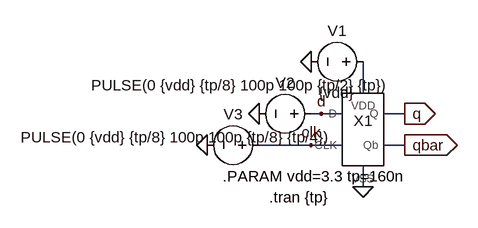
[diagram p0: schematic D_flipflop_tb_tran.asc]
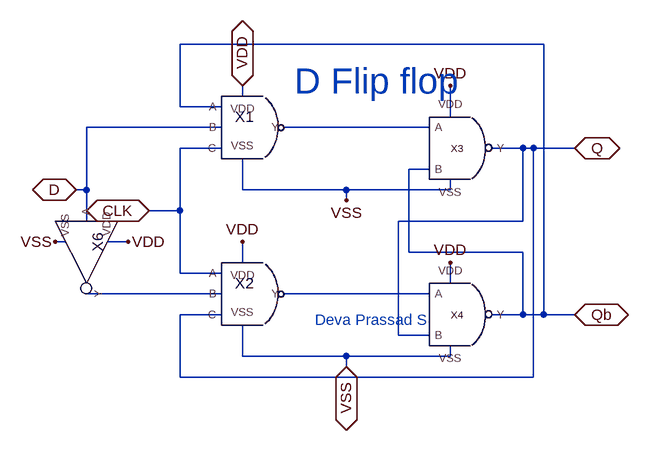
[diagram p1: sub-circuit d_flipflop.asc]
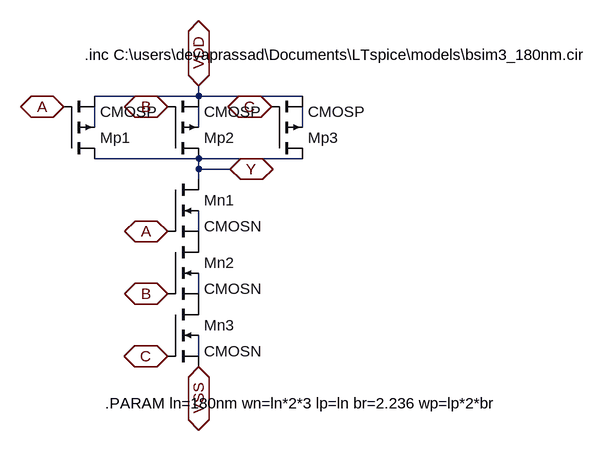
[diagram p2: sub-circuit nand3.asc]
D_flipflop_tb_tran.asc, the LTspice schematic file:
Version 4.1
SHEET 1 880 680
WIRE 192 96 192 48
WIRE 128 128 112 128
WIRE 160 128 128 128
WIRE 256 128 224 128
WIRE 112 176 32 176
WIRE 160 176 112 176
WIRE 256 176 224 176
WIRE 192 240 192 208
FLAG 192 240 0
FLAG 256 176 qbar
IOPIN 256 176 Out
FLAG 256 128 q
IOPIN 256 128 Out
FLAG 112 48 0
FLAG 32 128 0
FLAG -48 176 0
FLAG 112 176 clk
FLAG 128 128 d
SYMBOL voltage 208 48 R90
WINDOW 0 -32 56 VBottom 2
WINDOW 3 32 56 VTop 2
WINDOW 123 0 0 Left 0
WINDOW 39 0 0 Left 0
SYMATTR InstName V1
SYMATTR Value {vdd}
SYMBOL voltage 128 128 R90
WINDOW 0 -32 56 VBottom 2
WINDOW 3 -60 123 VTop 2
WINDOW 123 0 0 Left 0
WINDOW 39 0 0 Left 0
SYMATTR InstName V2
SYMATTR Value PULSE(0 {vdd} {tp/8} 100p 100p {tp/2} {tp})
SYMBOL voltage 48 176 R90
WINDOW 0 -32 56 VBottom 2
WINDOW 3 -28 141 VTop 2
WINDOW 123 0 0 Left 0
WINDOW 39 0 0 Left 0
SYMATTR InstName V3
SYMATTR Value PULSE(0 {vdd} {tp/8} 100p 100p {tp/8} {tp/4})
SYMBOL diglib\\flipflop1x\\D_flipflop 192 192 R0
SYMATTR InstName X1
TEXT 48 256 Left 2 !.tran {tp}
TEXT -24 224 Left 2 !.PARAM vdd=3.3 tp=160n

d_flipflop.asc, the sub-circuit schematic file:
Version 4.1
SHEET 1 1448 680
WIRE 640 -208 80 -208
WIRE 176 -128 176 -144
WIRE 80 -112 80 -208
WIRE 144 -112 80 -112
WIRE 496 -96 496 -144
WIRE 144 -80 -64 -80
WIRE 464 -80 240 -80
WIRE 144 -48 80 -48
WIRE 608 -48 560 -48
WIRE 624 -48 608 -48
WIRE 688 -48 624 -48
WIRE 464 -16 432 -16
WIRE -64 16 -64 -80
WIRE -64 16 -80 16
WIRE 176 16 176 -32
WIRE 336 16 176 16
WIRE 496 16 496 0
WIRE 496 16 336 16
WIRE 336 32 336 16
WIRE 80 48 80 -48
WIRE 80 48 32 48
WIRE -64 64 -64 16
WIRE 608 64 608 -48
WIRE 608 64 416 64
WIRE -96 96 -112 96
WIRE 0 96 -32 96
WIRE 432 112 432 -16
WIRE 608 112 432 112
WIRE 176 128 176 96
WIRE 80 144 80 48
WIRE 144 144 80 144
WIRE 496 160 496 128
WIRE 144 176 -64 176
WIRE 464 176 240 176
WIRE 144 208 80 208
WIRE 608 208 608 112
WIRE 608 208 560 208
WIRE 640 208 640 -208
WIRE 640 208 608 208
WIRE 688 208 640 208
WIRE 416 240 416 64
WIRE 464 240 416 240
WIRE 176 272 176 224
WIRE 336 272 176 272
WIRE 496 272 496 256
WIRE 496 272 336 272
WIRE 336 288 336 272
WIRE 80 304 80 208
WIRE 624 304 624 -48
WIRE 624 304 80 304
FLAG 32 48 CLK
IOPIN 32 48 BiDir
FLAG 688 208 Qb
IOPIN 688 208 BiDir
FLAG 688 -48 Q
IOPIN 688 -48 BiDir
FLAG 176 -144 VDD
IOPIN 176 -144 BiDir
FLAG 336 288 VSS
IOPIN 336 288 BiDir
FLAG -80 16 D
IOPIN -80 16 BiDir
FLAG 336 32 VSS
FLAG 496 -144 VDD
FLAG 176 96 VDD
FLAG 496 128 VDD
FLAG -112 96 VSS
FLAG 0 96 VDD
SYMBOL diglib\\inv1x\\inv1x -64 128 R90
SYMATTR InstName X6
SYMBOL diglib\\nand1x\\nand1x 512 -48 R0
SYMATTR InstName X3
SYMBOL diglib\\nand1x\\nand1x 512 208 R0
SYMATTR InstName X4
SYMBOL diglib\\nand1x\\nand3 208 -48 R0
SYMATTR InstName X1
SYMBOL diglib\\nand1x\\nand3 208 208 R0
SYMATTR InstName X2
TEXT 256 -152 Left 5 ;D Flip flop
TEXT 288 216 Left 2 ;Deva Prassad S

nand3.asc, the sub-circuit schematic file:
Version 4.1
SHEET 1 880 680
WIRE 208 -64 208 -80
WIRE 208 -64 48 -64
WIRE 368 -64 208 -64
WIRE 48 -16 48 -48
WIRE 208 -16 208 -48
WIRE 368 -16 368 -48
WIRE 208 32 48 32
WIRE 368 32 208 32
WIRE 208 48 208 32
WIRE 256 48 208 48
WIRE 208 64 208 48
WIRE 208 144 208 112
WIRE 208 240 208 208
WIRE 208 336 208 304
FLAG 0 -48 A
IOPIN 0 -48 BiDir
FLAG 160 -48 B
IOPIN 160 -48 BiDir
FLAG 320 -48 C
IOPIN 320 -48 BiDir
FLAG 160 144 A
IOPIN 160 144 BiDir
FLAG 160 240 B
IOPIN 160 240 BiDir
FLAG 160 336 C
IOPIN 160 336 BiDir
FLAG 208 352 VSS
IOPIN 208 352 BiDir
FLAG 208 -80 VDD
IOPIN 208 -80 BiDir
FLAG 256 48 Y
IOPIN 256 48 BiDir
SYMBOL nmos4 160 64 R0
SYMATTR InstName Mn1
SYMATTR Value CMOSN
SYMATTR Value2 l={ln} w={wn} ad={ln*wn} as={ln*wn} pd={2*ln+wn} ps={2*ln+wn}
SYMBOL pmos4 0 32 M180
SYMATTR InstName Mp1
SYMATTR Value CMOSP
SYMATTR Value2 l={lp} w={wp} ad={lp*wp} as={lp*wp} pd={2*lp+wp} ps={2*lp+wp}
SYMBOL nmos4 160 160 R0
SYMATTR InstName Mn2
SYMATTR Value CMOSN
SYMATTR Value2 l={ln} w={wn} ad={ln*wn} as={ln*wn} pd={2*ln+wn} ps={2*ln+wn}
SYMBOL nmos4 160 256 R0
SYMATTR InstName Mn3
SYMATTR Value CMOSN
SYMATTR Value2 l={ln} w={wn} ad={ln*wn} as={ln*wn} pd={2*ln+wn} ps={2*ln+wn}
SYMBOL pmos4 160 32 M180
SYMATTR InstName Mp2
SYMATTR Value CMOSP
SYMATTR Value2 l={lp} w={wp} ad={lp*wp} as={lp*wp} pd={2*lp+wp} ps={2*lp+wp}
SYMBOL pmos4 320 32 M180
SYMATTR InstName Mp3
SYMATTR Value CMOSP
SYMATTR Value2 l={lp} w={wp} ad={lp*wp} as={lp*wp} pd={2*lp+wp} ps={2*lp+wp}
TEXT 32 -128 Left 2 !.inc C:\\users\\devaprassad\\Documents\\LTspice\\models\\bsim3_180nm.cir
TEXT 64 408 Left 2 !.PARAM ln=180nm wn=ln*2*3 lp=ln br=2.236 wp=lp*2*br

The netlist it stands for:
* D_flipflop_tb_tran.asc
V1 N001 0 {vdd}
V2 d 0 PULSE(0 {vdd} {tp/8} 100p 100p {tp/2} {tp})
V3 clk 0 PULSE(0 {vdd} {tp/8} 100p 100p {tp/8} {tp/4})
X§X1 qbar clk d q N001 0 d_flipflop

* block symbol definitions
.subckt d_flipflop Qb CLK D Q VDD VSS
X§X6 D VDD VSS N002 inv1x  ; pins A VDD VSS Y
X§X3 Q VDD VSS N001 Qb nand1x  ; pins Y VDD VSS A B
X§X4 Qb VDD VSS N003 Q nand1x  ; pins Y VDD VSS A B
X§X1 Qb D CLK VDD VSS N001 nand3
X§X2 CLK N002 Q VDD VSS N003 nand3
* D Flip flop
* Deva Prassad S
.ends d_flipflop

.subckt nand3 A B C VDD VSS Y
Mn1 Y A P001 N004 CMOSN l={ln} w={wn} ad={ln*wn} as={ln*wn} pd={2*ln+wn} ps={2*ln+wn}
Mp1 Y A VDD N001 CMOSP l={lp} w={wp} ad={lp*wp} as={lp*wp} pd={2*lp+wp} ps={2*lp+wp}
Mn2 P001 B P002 N005 CMOSN l={ln} w={wn} ad={ln*wn} as={ln*wn} pd={2*ln+wn} ps={2*ln+wn}
Mn3 P002 C VSS N006 CMOSN l={ln} w={wn} ad={ln*wn} as={ln*wn} pd={2*ln+wn} ps={2*ln+wn}
Mp2 Y B VDD N002 CMOSP l={lp} w={wp} ad={lp*wp} as={lp*wp} pd={2*lp+wp} ps={2*lp+wp}
Mp3 Y C VDD N003 CMOSP l={lp} w={wp} ad={lp*wp} as={lp*wp} pd={2*lp+wp} ps={2*lp+wp}
.inc C:\users\devaprassad\Documents\LTspice\models\bsim3_180nm.cir
.PARAM ln=180nm wn=ln*2*3 lp=ln br=2.236 wp=lp*2*br
.ends nand3

.model NMOS NMOS
.model PMOS PMOS
.lib standard.mos
.tran {tp}
.PARAM vdd=3.3 tp=160n
.backanno
.end